# Altium project FMUM.PrjPcb
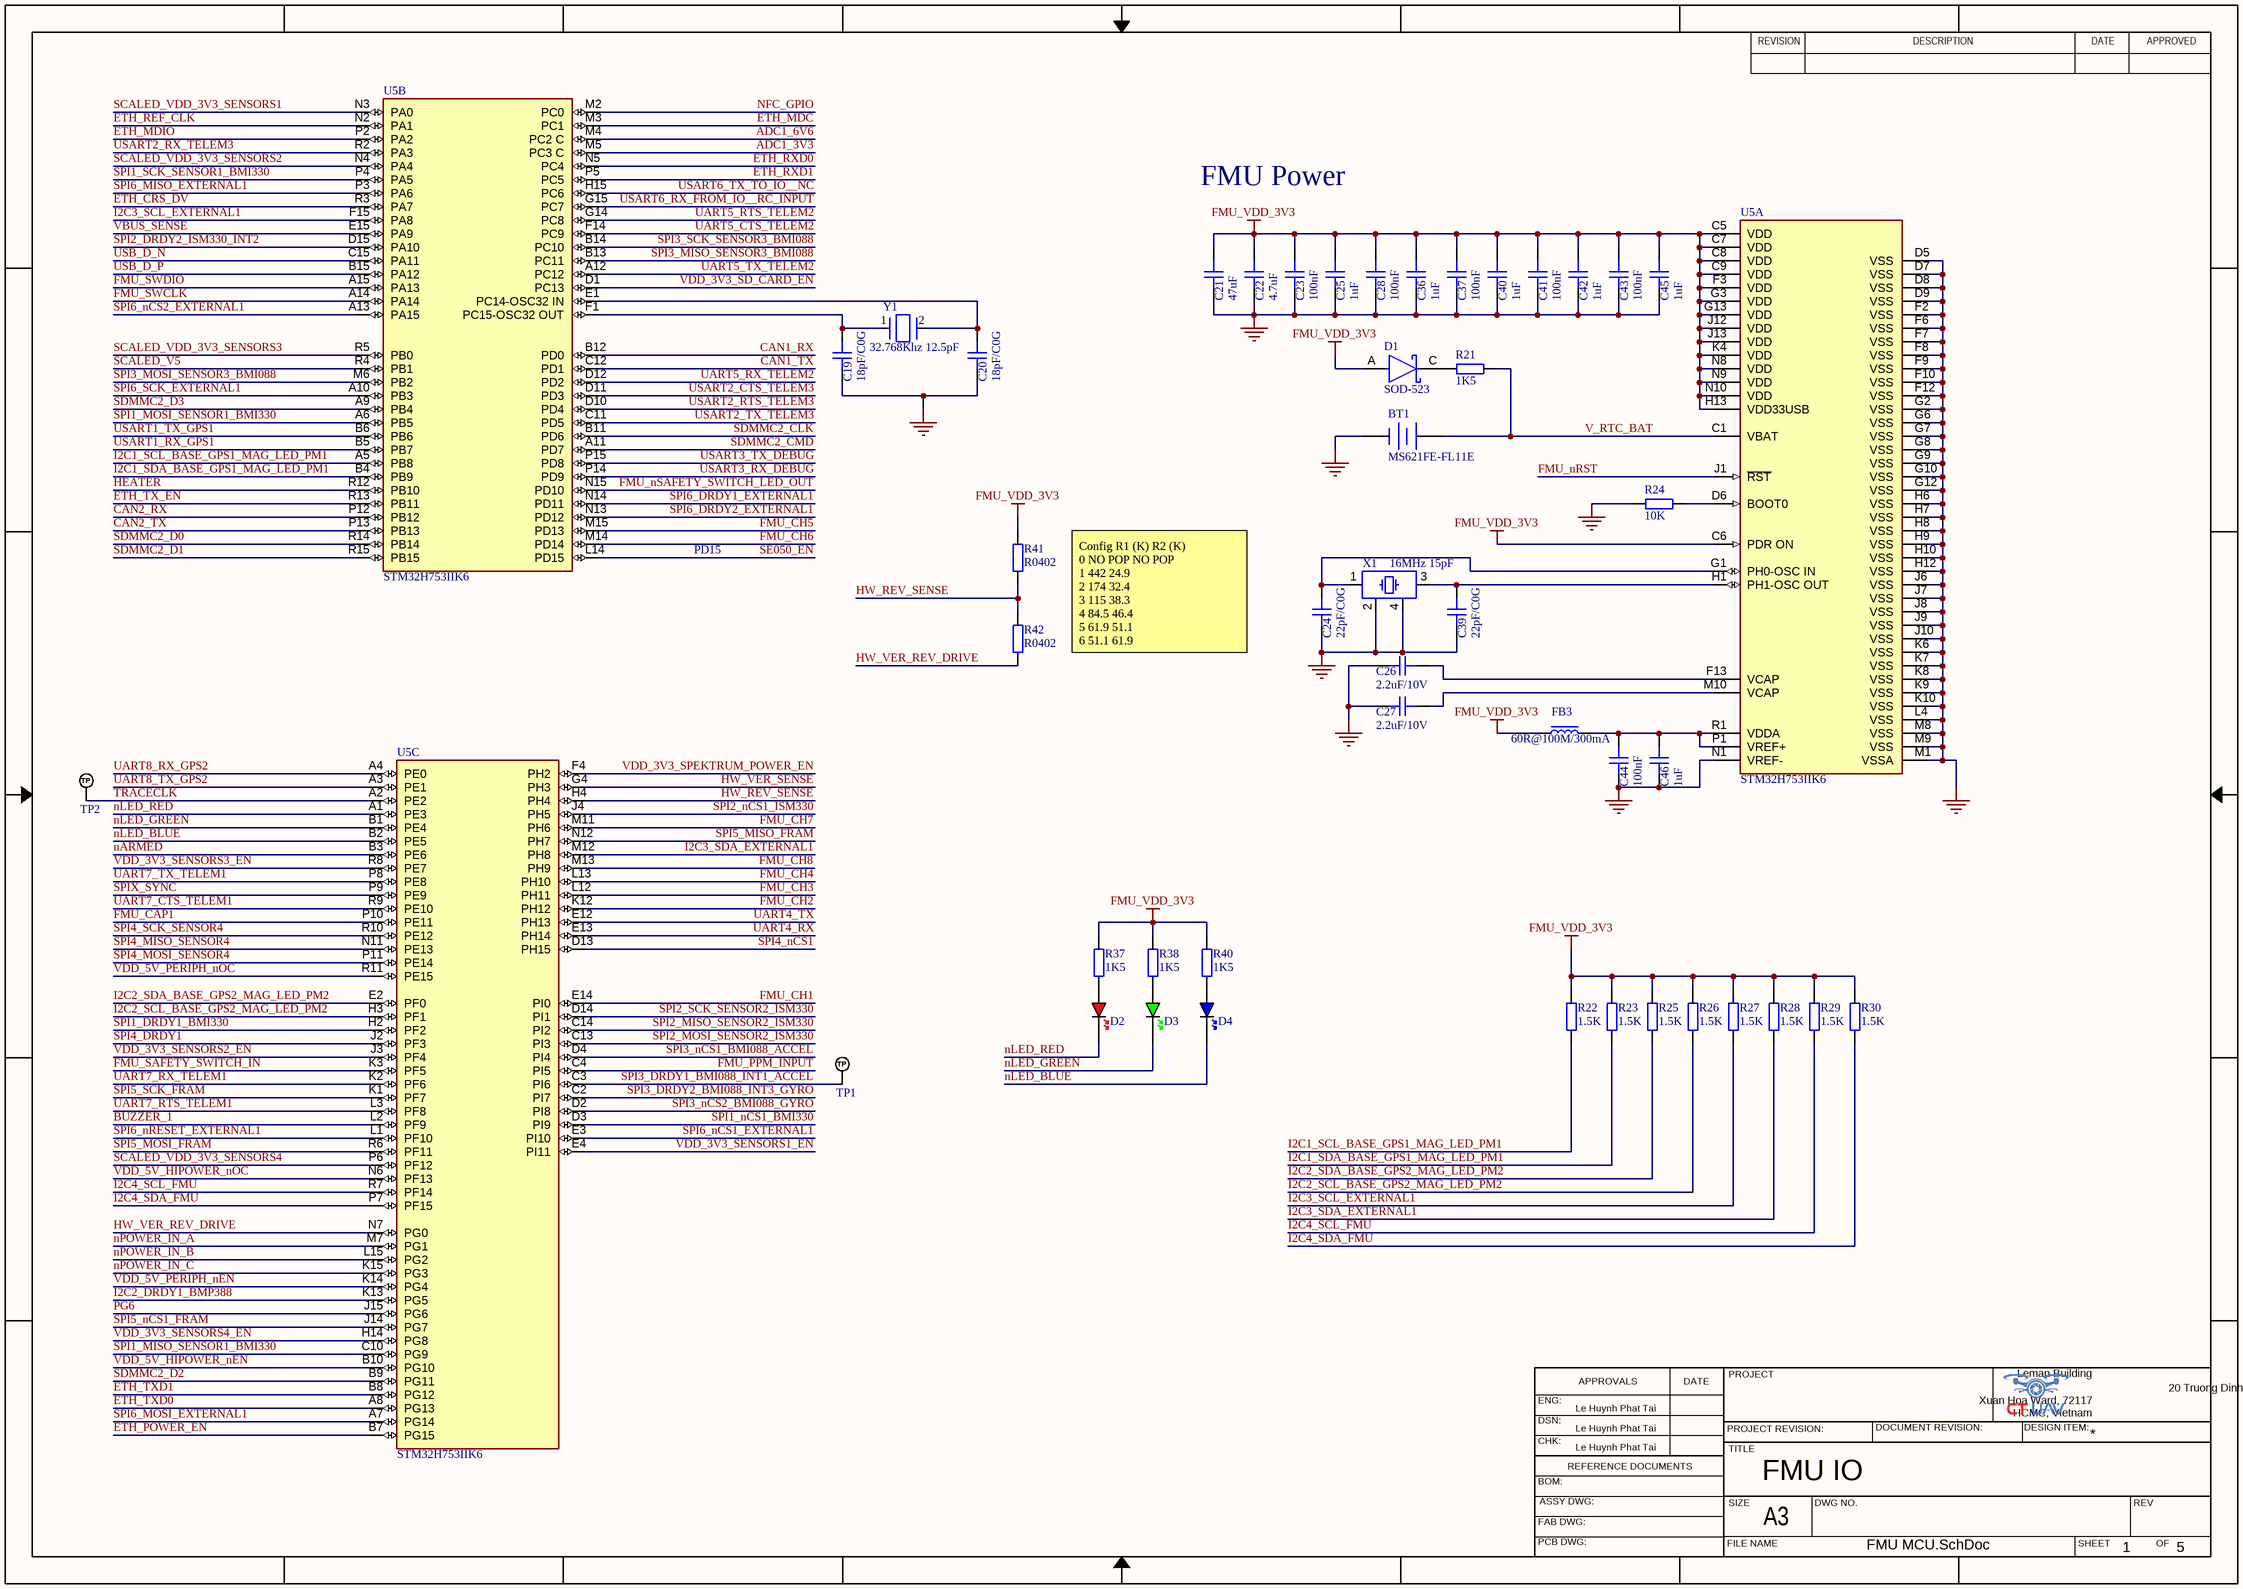
[diagram p0: FMU MCU.SchDoc]
5 sheets, 122 parts. Net scope: global (net labels, ports and power ports of the same name join across sheets).
Board files: FMUM.PcbDoc, 6-layer.PcbDoc
Sheets:
  FMU MCU.SchDoc
  Power.SchDoc
  PAB.SchDoc
  Memory.SchDoc
  Sensors.SchDoc

## Sheet FMU MCU.SchDoc: FMU IO
size 420 x 297 mm; CheckedBy: Le Huynh Phat Tai; DrawnBy: Le Huynh Phat Tai; Engineer: Le Huynh Phat Tai; SheetNumber: 1; SheetTotal: 5

### Parts
BT1  MS621FE-FL11E  [MS621R]
C19  18pF/C0G  [CAPC1005X05N]
C20  18pF/C0G  [CAPC1005X05N]
C21  47uF  [CAPC2012X14N]
C22  4.7uF  [CAPC1608X10N]
C23  100nF  [CAPC1005X05N]
C24  22pF/C0G  [CAPC1005X05N]
C25  1uF  [CAPC1005X05N]
C26  2.2uF/10V  [CAPC1608X10N]
C27  2.2uF/10V  [CAPC1608X10N]
C28  100nF  [CAPC1005X05N]
C36  1uF  [CAPC1005X05N]
C37  100nF  [CAPC1005X05N]
C39  22pF/C0G  [CAPC1005X05N]
C40  1uF  [CAPC1005X05N]
C41  100nF  [CAPC1005X05N]
C42  1uF  [CAPC1005X05N]
C43  100nF  [CAPC1005X05N]
C44  100nF  [CAPC1005X05N]
C45  1uF  [CAPC1005X05N]
C46  1uF  [CAPC1005X05N]
D1  SOD-523  [SODFL160X70-2N]
D2  RED  [LED_0603_RED]  (value not drawn)
D3  GREEN  [LED_0603_GREEN]  (value not drawn)
D4  BLUE  [LED_0603_BLUE]  (value not drawn)
FB3  60R@100M/300mA  [INDC1005X06N]
R21  1K5  [RESC1005X04N]
R22  1.5K  [RESC1005X04N]
R23  1.5K  [RESC1005X04N]
R24  10K  [RESC1005X04N]
R25  1.5K  [RESC1005X04N]
R26  1.5K  [RESC1005X04N]
R27  1.5K  [RESC1005X04N]
R28  1.5K  [RESC1005X04N]
R29  1.5K  [RESC1005X04N]
R30  1.5K  [RESC1005X04N]
R37  1K5  [RESC1005X04N]
R38  1K5  [RESC1005X04N]
R40  1K5  [RESC1005X04N]
R41  R0402  [RESC1005X04N]
R42  R0402  [RESC1005X04N]
TP1  TP_NOBOM  [PAD_RND_1MM]  (value not drawn)  (no BOM)
TP2  TP_NOBOM  [PAD_RND_1MM]  (value not drawn)  (no BOM)
U5  STM32H753IIK6  [BGA176C65P15X15_1000X1000X60N]  (parts A,B,C of 3)
X1  16MHz 15pF  [OSCCC320X250X80]
Y1  32.768Khz 12.5pF  [XTAL3215X80N-2N]

### Nets
FMU_VDD_3V3: C21.2 C22.2 C23.2 C25.2 C28.2 C36.2 C37.2 C40.2 C41.2 C42.2 C43.2 C45.2 D1.A FB3.1 R22.2 R23.2 R25.2 R26.2 R27.2 R28.2 R29.2 R30.2 R37.1 R38.1 R40.1 R41.1 U5.C5(VDD) U5.C6(PDR_ON) U5.C7(VDD) U5.C8(VDD) U5.C9(VDD) U5.F3(VDD) U5.G3(VDD) U5.G13(VDD) U5.H13(VDD33USB) U5.J12(VDD) U5.J13(VDD) U5.K4(VDD) U5.N8(VDD) U5.N9(VDD) U5.N10(VDD)
GND: BT1.2(-) C19.1 C20.1 C21.1 C22.1 C23.1 C24.1 C25.1 C26.2 C27.1 C28.1 C36.1 C37.1 C39.1 C40.1 C41.1 C42.1 C43.1 C44.1 C45.1 C46.1 R24.1 U5.D5(VSS) U5.D7(VSS) U5.D8(VSS) U5.D9(VSS) U5.F2(VSS) U5.F6(VSS) U5.F7(VSS) U5.F8(VSS) U5.F9(VSS) U5.F10(VSS) U5.F12(VSS) U5.G2(VSS) U5.G6(VSS) U5.G7(VSS) U5.G8(VSS) U5.G9(VSS) U5.G10(VSS) U5.G12(VSS) U5.H6(VSS) U5.H7(VSS) U5.H8(VSS) U5.H9(VSS) U5.H10(VSS) U5.H12(VSS) U5.J6(VSS) U5.J7(VSS) U5.J8(VSS) U5.J9(VSS) U5.J10(VSS) U5.K6(VSS) U5.K7(VSS) U5.K8(VSS) U5.K9(VSS) U5.K10(VSS) U5.L4(VSS) U5.M1(VSSA) U5.M8(VSS) U5.M9(VSS) U5.N1(VREF-) X1.2 X1.4
ADC1_3V3: U5.M5(PC3_C)
ADC1_6V6: U5.M4(PC2_C)
BUZZER_1: U5.L2(PF9)
CAN1_RX: U5.B12(PD0)
CAN1_TX: U5.C12(PD1)
CAN2_RX: U5.P12(PB12)
CAN2_TX: U5.P13(PB13)
ETH_CRS_DV: U5.R3(PA7)
ETH_MDC: U5.M3(PC1)
ETH_MDIO: U5.P2(PA2)
ETH_POWER_EN: U5.B7(PG15)
ETH_REF_CLK: U5.N2(PA1)
ETH_RXD0: U5.N5(PC4)
ETH_RXD1: U5.P5(PC5)
ETH_TX_EN: U5.R13(PB11)
ETH_TXD0: U5.A8(PG13)
ETH_TXD1: U5.B8(PG12)
FMU_CAP1: U5.P10(PE11)
FMU_CH1: U5.E14(PI0)
FMU_CH2: U5.K12(PH12)
FMU_CH3: U5.L12(PH11)
FMU_CH4: U5.L13(PH10)
FMU_CH5: U5.M15(PD13)
FMU_CH6: U5.M14(PD14)
FMU_CH7: U5.M11(PH6)
FMU_CH8: U5.M13(PH9)
FMU_nRST: U5.J1(~{RST})
FMU_nSAFETY_SWITCH_LED_OUT: U5.N15(PD10)
FMU_PPM_INPUT: U5.C4(PI5)
FMU_SAFETY_SWITCH_IN: U5.K3(PF5)
FMU_SWCLK: U5.A14(PA14)
FMU_SWDIO: U5.A15(PA13)
HEATER: U5.R12(PB10)
HW_REV_SENSE: R41.2 R42.1 U5.H4(PH4)
HW_VER_REV_DRIVE: R42.2 U5.N7(PG0)
HW_VER_SENSE: U5.G4(PH3)
I2C1_SCL_BASE_GPS1_MAG_LED_PM1: R22.1 U5.A5(PB8)
I2C1_SDA_BASE_GPS1_MAG_LED_PM1: R23.1 U5.B4(PB9)
I2C2_DRDY1_BMP388: U5.K13(PG5)
I2C2_SCL_BASE_GPS2_MAG_LED_PM2: R26.1 U5.H3(PF1)
I2C2_SDA_BASE_GPS2_MAG_LED_PM2: R25.1 U5.E2(PF0)
I2C3_SCL_EXTERNAL1: R27.1 U5.F15(PA8)
I2C3_SDA_EXTERNAL1: R28.1 U5.M12(PH8)
I2C4_SCL_FMU: R29.1 U5.R7(PF14)
I2C4_SDA_FMU: R30.1 U5.P7(PF15)
nARMED: U5.B3(PE6)
NFC_GPIO: U5.M2(PC0)
nLED_BLUE: D4.K U5.B2(PE5)
nLED_GREEN: D3.K U5.B1(PE4)
nLED_RED: D2.K U5.A1(PE3)
nPOWER_IN_A: U5.M7(PG1)
nPOWER_IN_B: U5.L15(PG2)
nPOWER_IN_C: U5.K15(PG3)
PG6: U5.J15(PG6)
SCALED_V5: U5.R4(PB1)
SCALED_VDD_3V3_SENSORS1: U5.N3(PA0)
SCALED_VDD_3V3_SENSORS2: U5.N4(PA4)
SCALED_VDD_3V3_SENSORS3: U5.R5(PB0)
SCALED_VDD_3V3_SENSORS4: U5.P6(PF12)
SDMMC2_CLK: U5.B11(PD6)
SDMMC2_CMD: U5.A11(PD7)
SDMMC2_D0: U5.R14(PB14)
SDMMC2_D1: U5.R15(PB15)
SDMMC2_D2: U5.B9(PG11)
SDMMC2_D3: U5.A9(PB4)
SE050_EN: U5.L14(PD15)
SPI1_DRDY1_BMI330: U5.H2(PF2)
SPI1_MISO_SENSOR1_BMI330: U5.C10(PG9)
SPI1_MOSI_SENSOR1_BMI330: U5.A6(PB5)
SPI1_nCS1_BMI330: U5.D3(PI9)
SPI1_SCK_SENSOR1_BMI330: U5.P4(PA5)
SPI2_DRDY2_ISM330_INT2: U5.D15(PA10)
SPI2_MISO_SENSOR2_ISM330: U5.C14(PI2)
SPI2_MOSI_SENSOR2_ISM330: U5.C13(PI3)
SPI2_nCS1_ISM330: U5.J4(PH5)
SPI2_SCK_SENSOR2_ISM330: U5.D14(PI1)
SPI3_DRDY1_BMI088_INT1_ACCEL: TP1.1(TP) U5.C3(PI6)
SPI3_DRDY2_BMI088_INT3_GYRO: U5.C2(PI7)
SPI3_MISO_SENSOR3_BMI088: U5.B13(PC11)
SPI3_MOSI_SENSOR3_BMI088: U5.M6(PB2)
SPI3_nCS1_BMI088_ACCEL: U5.D4(PI4)
SPI3_nCS2_BMI088_GYRO: U5.D2(PI8)
SPI3_SCK_SENSOR3_BMI088: U5.B14(PC10)
SPI4_DRDY1: U5.J2(PF3)
SPI4_MISO_SENSOR4: U5.N11(PE13)
SPI4_MOSI_SENSOR4: U5.P11(PE14)
SPI4_nCS1: U5.D13(PH15)
SPI4_SCK_SENSOR4: U5.R10(PE12)
SPI5_MISO_FRAM: U5.N12(PH7)
SPI5_MOSI_FRAM: U5.R6(PF11)
SPI5_nCS1_FRAM: U5.J14(PG7)
SPI5_SCK_FRAM: U5.K1(PF7)
SPI6_DRDY1_EXTERNAL1: U5.N14(PD11)
SPI6_DRDY2_EXTERNAL1: U5.N13(PD12)
SPI6_MISO_EXTERNAL1: U5.P3(PA6)
SPI6_MOSI_EXTERNAL1: U5.A7(PG14)
SPI6_nCS1_EXTERNAL1: U5.E3(PI10)
SPI6_nCS2_EXTERNAL1: U5.A13(PA15)
SPI6_nRESET_EXTERNAL1: U5.L1(PF10)
SPI6_SCK_EXTERNAL1: U5.A10(PB3)
SPIX_SYNC: U5.P9(PE9)
TRACECLK: TP2.1(TP) U5.A2(PE2)
UART4_RX: U5.E13(PH14)
UART4_TX: U5.E12(PH13)
UART5_CTS_TELEM2: U5.F14(PC9)
UART5_RTS_TELEM2: U5.G14(PC8)
UART5_RX_TELEM2: U5.D12(PD2)
UART5_TX_TELEM2: U5.A12(PC12)
UART7_CTS_TELEM1: U5.R9(PE10)
UART7_RTS_TELEM1: U5.L3(PF8)
UART7_RX_TELEM1: U5.K2(PF6)
UART7_TX_TELEM1: U5.P8(PE8)
UART8_RX_GPS2: U5.A4(PE0)
UART8_TX_GPS2: U5.A3(PE1)
USART1_RX_GPS1: U5.B5(PB7)
USART1_TX_GPS1: U5.B6(PB6)
USART2_CTS_TELEM3: U5.D11(PD3)
USART2_RTS_TELEM3: U5.D10(PD4)
USART2_RX_TELEM3: U5.R2(PA3)
USART2_TX_TELEM3: U5.C11(PD5)
USART3_RX_DEBUG: U5.P14(PD9)
USART3_TX_DEBUG: U5.P15(PD8)
USART6_RX_FROM_IO__RC_INPUT: U5.G15(PC7)
USART6_TX_TO_IO__NC: U5.H15(PC6)
USB_D_N: U5.C15(PA11)
USB_D_P: U5.B15(PA12)
V_RTC_BAT: BT1.1(+) R21.2 U5.C1(VBAT)
VBUS_SENSE: U5.E15(PA9)
VDD_3V3_SD_CARD_EN: U5.D1(PC13)
VDD_3V3_SENSORS1_EN: U5.E4(PI11)
VDD_3V3_SENSORS2_EN: U5.J3(PF4)
VDD_3V3_SENSORS3_EN: U5.R8(PE7)
VDD_3V3_SENSORS4_EN: U5.H14(PG8)
VDD_3V3_SPEKTRUM_POWER_EN: U5.F4(PH2)
VDD_5V_HIPOWER_nEN: U5.B10(PG10)
VDD_5V_HIPOWER_nOC: U5.N6(PF13)
VDD_5V_PERIPH_nEN: U5.K14(PG4)
VDD_5V_PERIPH_nOC: U5.R11(PE15)
NetC19_2: C19.2 U5.F1(PC15-OSC32_OUT) Y1.1
NetC20_2: C20.2 U5.E1(PC14-OSC32_IN) Y1.2
NetC24_2: C24.2 U5.G1(PH0-OSC_IN) X1.1
NetC26_1: C26.1 U5.F13(VCAP)
NetC27_2: C27.2 U5.M10(VCAP)
NetC39_2: C39.2 U5.H1(PH1-OSC_OUT) X1.3
NetC44_2: C44.2 C46.2 FB3.2 U5.P1(VREF+) U5.R1(VDDA)
NetD1_C: D1.C R21.1
NetD2_A: D2.A R37.2
NetD3_A: D3.A R38.2
NetD4_A: D4.A R40.2
NetR24_2: R24.2 U5.D6(BOOT0)

### Notes on the sheet
- FMU Power
- PD15
- Config	R1 (K)	R2 (K)
  0	NO POP	NO POP
  1	442	24.9
  2	174	32.4
  3	115	38.3
  4	84.5	46.4
  5	61.9	51.1
  6	51.1	61.9
  7	46.4	84.5
  8	38.3	115
  9	32.4	174
  10	24.9	442
- REVISION
- DESCRIPTION
- DATE
- APPROVED
- ENG:
- APPROVALS
- PROJECT
- Xuan Hoa Ward, 72117
- Leman Building
- 20 Truong Dinh
- DSN:
- CHK:
- REFERENCE DOCUMENTS
- PROJECT REVISION:
- TITLE
- DOCUMENT REVISION:
- DESIGN ITEM:
- HCMC, Vietnam
- BOM:
- FAB DWG:
- PCB DWG:
- ASSY DWG:
- FILE NAME
- SIZE
- A3
- DWG NO.
- SHEET
- REV
- OF

### Library data of the parts
BT1 = BATTERY_SINGLE-2: MS Lihium Rechargeable Battery, 3 V, -20 to 60 degC, Tray; Manufacturer: SeikoInstruments; Brand: SeikoInstrumentsMicroEnergy; Output Voltage: 3V; Capacity: 5.5mAh; Chemistry: Lithium; Battery Size: 621; Unit Weight: 0.008113oz; Datasheet URL: http://datasheet.octopart.com/MS621FE-FL11E-Seiko-datasheet-5320152.pdf; Rechargeable/Non-Rechargeable: Rechargeable; Orientation: Vertical; Height: 2.1mm; Series: MS; Datasheet Version: Jan-08; Type: CoinCellBatterywithLeads; Diameter: 6.8mm; Mounting Style: WithLeads; Product Category: CoinCellBattery; Termination Style: ThroughHole; Packaging: Tray; Manufacturer URL: http://www.sii.co.jp/en/; RoHS: NotApplicable; Factory Pack Quantity: 100
C19 C20 C23-C25 C28 C36 C37 C39-C46 = CAP_0402: Capacitor SMD 0402; Manufacturer: *; Manufacturer Part Number: *; Distributor Link: *; LCSC: *; Rating: *; Dielectric: *
C21 = CAP_0805: Capacitor SMD 0805; Manufacturer: *; Manufacturer Part Number: *; Distributor Link: *; LCSC: *; Rating: *; Dielectric: *
C22 C26 C27 = CAP_0603: Capacitor SMD 0603; Manufacturer: *; Manufacturer Part Number: *; Distributor Link: *; LCSC: *; Rating: *; Dielectric: *
D1 = 1d6ec82d83fb6aee721767c19dac4b9: DIODE SCHOTTKY SOD523; Manufacturer: Diodes Inc.; Manufacturer Part Number: SDM20U30-7; Automotive Grade: Grade 1; Forward Current: 200mA; Max Surge Forward Current: 1A; Max Junction Temp: +125°C; Reverse Voltage: 30V; Peak Reverse Current: 150uA; ComponentLink2Description: Datasheet; Automotive: Yes; Octopart: https://octopart.com/sdm20u30-7-diodes+inc.-333874; Device Class L1: Discrete Semiconductors; Footprint Url: https://www.diodes.com/assets/Package-Files/SOD523.pdf; Device Class L3: Schottky Diodes; Height: 0.65mm; Lead Free: Yes; Mouser Description: SDM20U30 Series 20 V 200 mA Surface Mount Schottky Barrier Diode - SOD-523; Temperature Range Low: -65°C; Digikey Description: DIODE SCHOTTKY 30V 200MA SOD523; Category: Diode; RoHS: TRUE; Temperature Range High: +125°C; ComponentLink2URL: https://www.diodes.com/assets/Datasheets/ds30397.pdf; Device Class L2: Diodes; Max Repetitive Reverse Voltage: 30V; Temperature: -65°C to +125°C; Package: SOD523
D2 = LED_0603_RED: LED 0603 RED SMD
D3 = LED_0603_GREEN: LED 0603 GREEN SMD
D4 = LED_0603_BLUE: LED 0603 BLUE SMD
FB3 = FB_0402: Ferrite Bead SMD 0402; Manufacturer: *; Manufacturer Part Number: *; Distributor Link: *; LCSC: *
R21-R30 R37 R38 R40-R42 = RES_0402: Resistor SMD 0402; Manufacturer: *; Manufacturer Part Number: *; Distributor Link: *; LCSC: *
TP1 TP2 = TEST_POINT_RND_1MM: Test Point Round 1mm (NO BOM)
U5 = f2632c7e739cd93bf56a941e5fc9246: UFBGA 10X10X0.6 176+; Manufacturer: STMicroelectronics; Number Of I/Os: 140; Frequency: 400MHz; Data Bus Width: 32bits; Number Of Uart Channels: 9; Number Of Spi Channels: 6; Number Of Timers/Counters: 20; Min Supply Voltage: 1.62V; Memory Size: 2MBytes; Max Junction Temp: +125°C; Number Of I2C Channels: 4; Number Of Pwm Channels: 42; Core Architecture: ARM Cortex-M7; Number Of Adc Channels: 36; Number Of A/D Converters: 3; Max Supply Voltage: 3.6V; Number Of Usb Channels: 2; Interface: I2C,SPI,UART,USART,CAN,USB,LIN,IrDA,Ethernet,I2S,Other; Memory Type: FLASH; Number Of Cores: 1; Ram Size: 1MBytes; Category: IC; Automotive: No; Device Class L1: Integrated Circuits (ICs); ComponentLink2URL: https://www.st.com/resource/en/datasheet/stm32h753ii.pdf; Manufacturer Part Number: STM32H753IIK6; Device Class L2: Embedded Processors and Controllers; Ambient Temperature Range Low: -40°C; ComponentLink2Description: Datasheet; Temperature Range High: +125°C; Temperature Range Low: -40°C; Ipc Land Pattern Name: BGA225N65P15X15_1000X1000X60; Lead Free: Yes; Ambient Temperature Range High: +85°C; Height: 0.6mm; Package: UFBGA176+25-A0E7; Mouser Description: MCU 32-Bit STM32 ARM Cortex M7 RISC 2MB Flash 1.8V/2.5V/3.3V 176-Pin UFBGA Tray; Device Class L3: Microcontrollers; Temperature: -40°C to +125°C; Digikey Description: UFBGA 10X10X0.6 176+; Octopart: https://octopart.com/stm32h753iik6-stmicroelectronics-84735750; Number Of Ethernet Channels: 1; RoHS: TRUE
X1 = TSX-3225_24.0000MF15X-AC: Crystal SMD 24MHz 10PPM 7pF 3225; Manufacturer: Epson; Manufacturer Part Number: TSX-3225 24.0000MF15X-AC
Y1 = c23a69dc6c9e2f18f2079038eb95dd1: NX3215SA-32.768K-STD-MUA-14 Parallel - Fundamental Quartz Crystal, 0.032768MHz Nom; NexarPartId: 22488149; ESR (Equivalent Series Resistance): 70kΩ; Frequency Tolerance: 0.002%; Load Capacitance: 6pF; Width: 1.4986mm; Length: 3.2004mm; RoHS: Compliant; Case/Package: SMD/SMT; Mount: Surface Mount; Height: 889µm; Number of Pins: 2; Packaging: Tape & Reel (TR); Max Operating Temperature: 85°C; Frequency: 32.768kHz; Min Operating Temperature: -40°C

## Sheet Power.SchDoc
size 420 x 297 mm; SheetNumber: 2; SheetTotal: 5
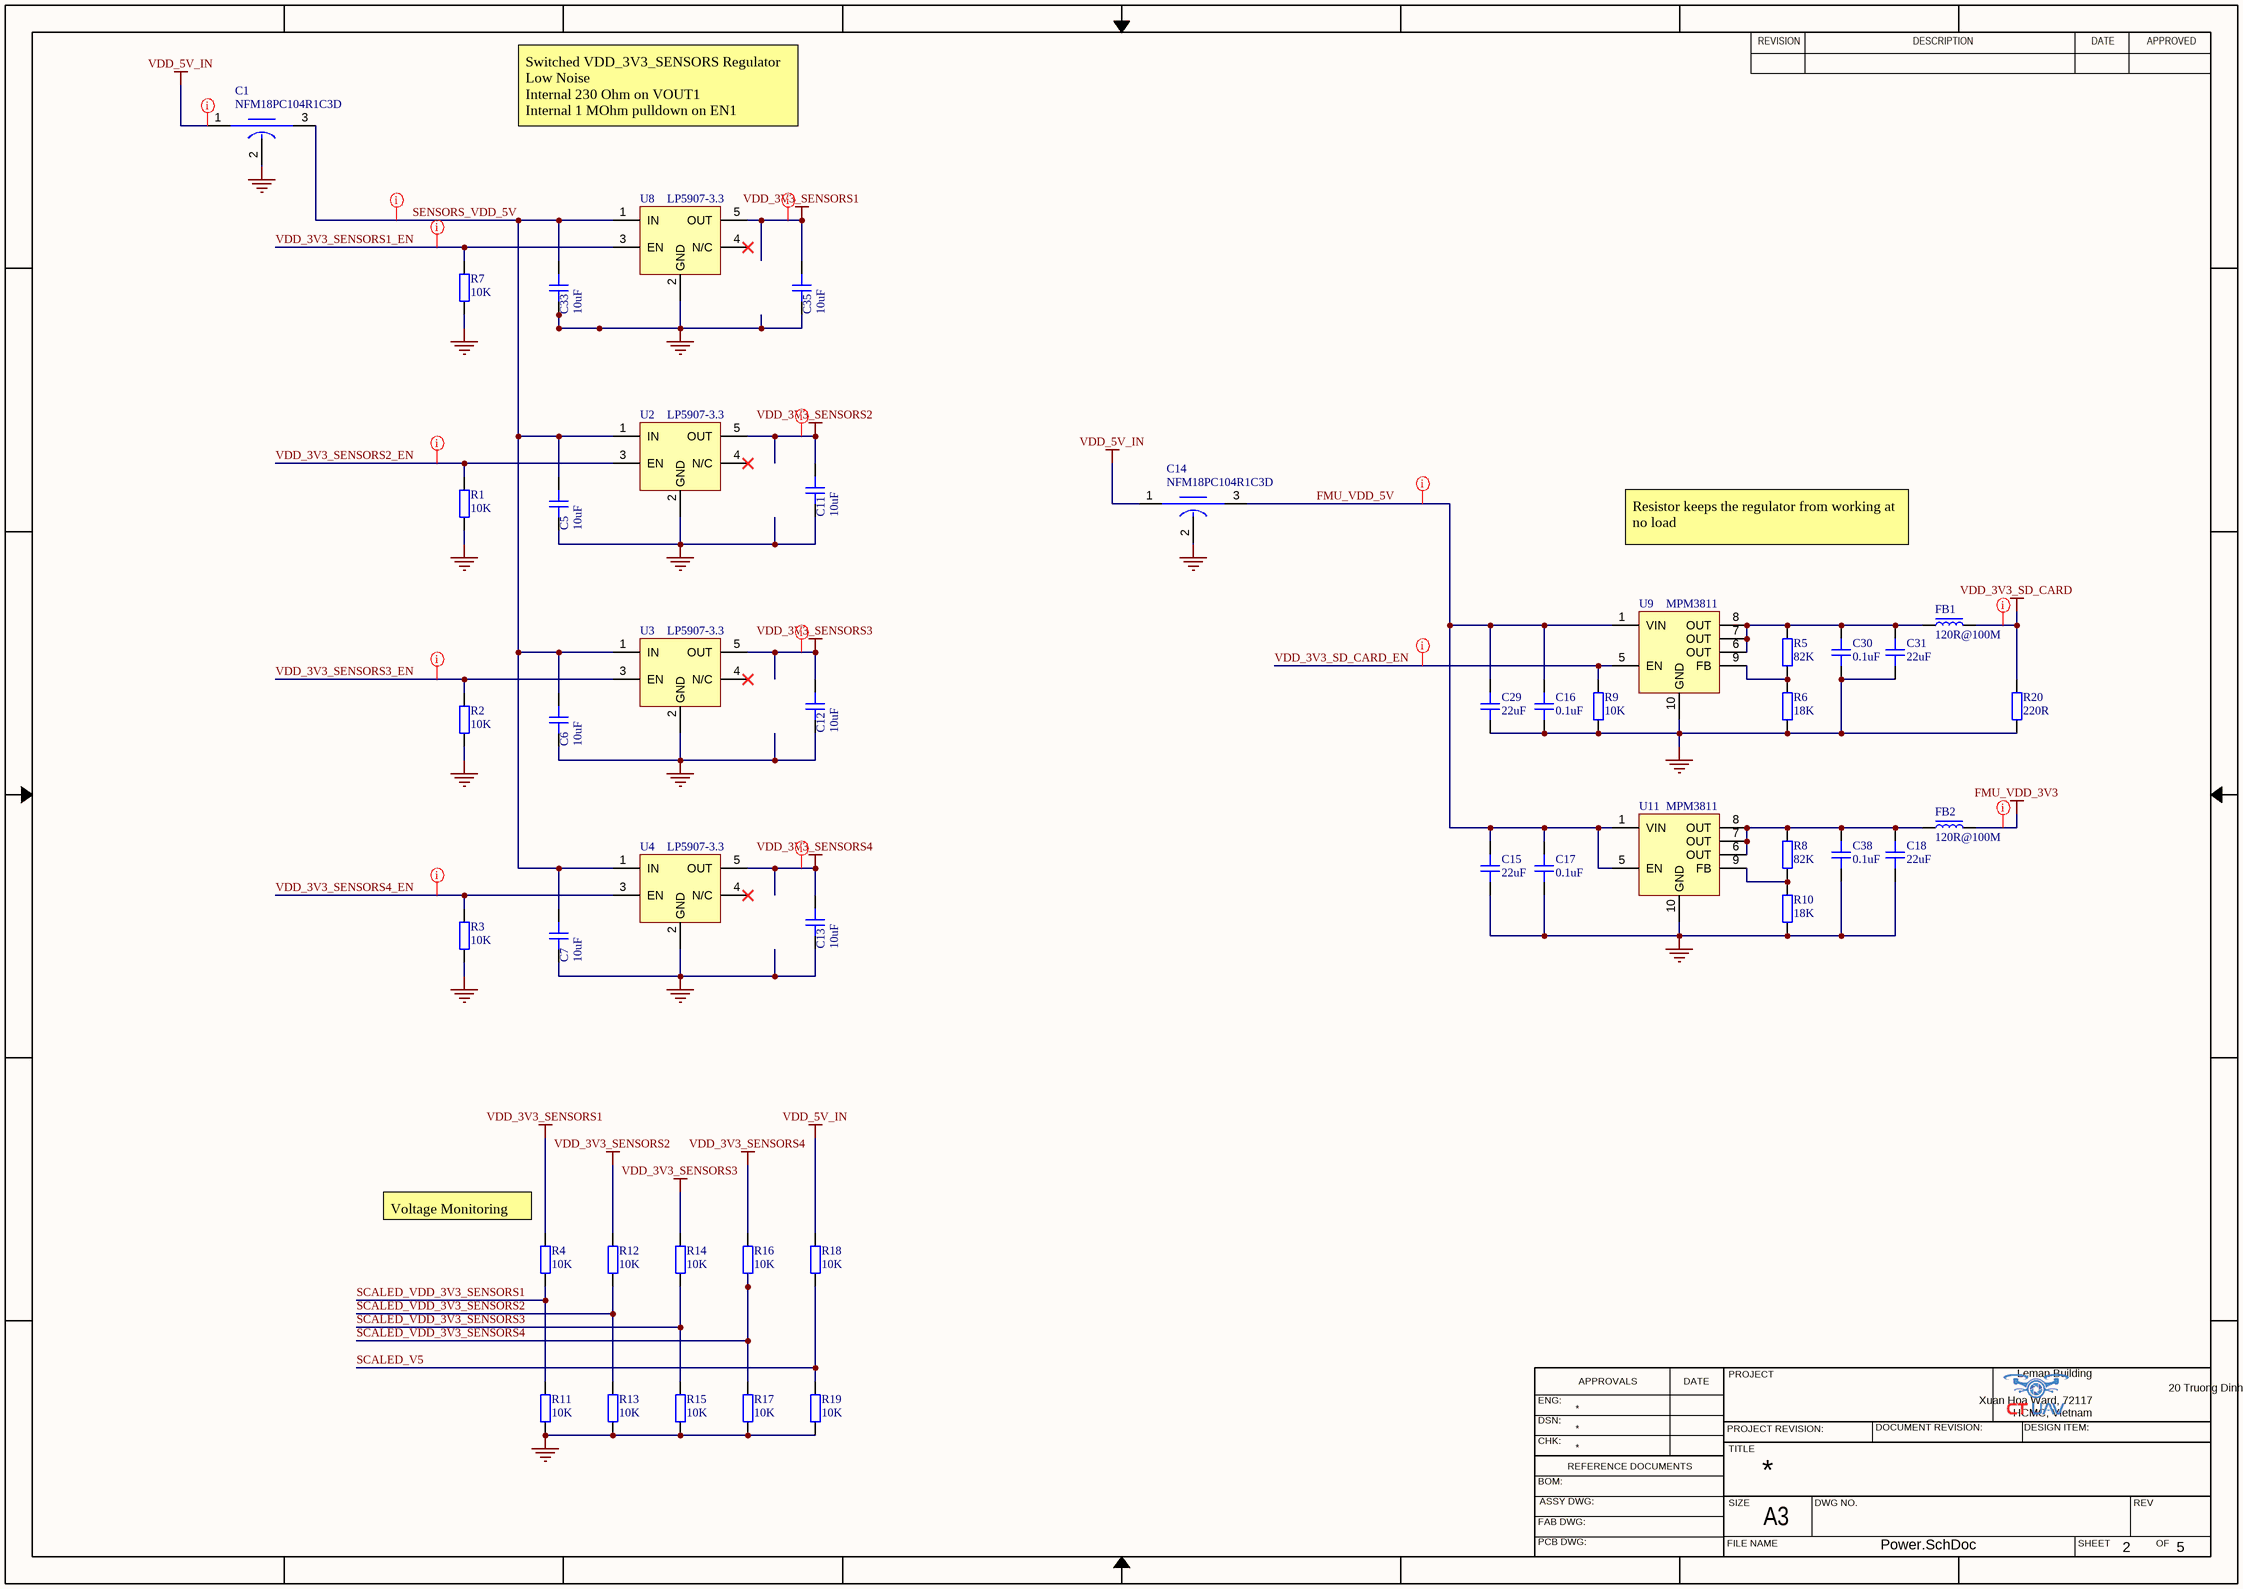
[diagram p1: Power.SchDoc]

### Parts
C1  NFM18PC104R1C3D  [NFM18PC104R1C3_0603_NO_VIA]
C5  10uF  [CAPC1608X10N]
C6  10uF  [CAPC1608X10N]
C7  10uF  [CAPC1608X10N]
C11  10uF  [CAPC1608X10N]
C12  10uF  [CAPC1608X10N]
C13  10uF  [CAPC1608X10N]
C14  NFM18PC104R1C3D  [NFM18PC104R1C3_0603_NO_VIA]
C15  22uF  [CAPC1608X10N]
C16  0.1uF  [CAPC1005X05N]
C17  0.1uF  [CAPC1005X05N]
C18  22uF  [CAPC1608X10N]
C29  22uF  [CAPC1608X10N]
C30  0.1uF  [CAPC1005X05N]
C31  22uF  [CAPC1608X10N]
C33  10uF  [CAPC1608X10N]
C35  10uF  [CAPC1608X10N]
C38  0.1uF  [CAPC1005X05N]
FB1  120R@100M  [INDC1005X06N]
FB2  120R@100M  [INDC1005X06N]
R1  10K  [RESC1005X04N]
R2  10K  [RESC1005X04N]
R3  10K  [RESC1005X04N]
R4  10K  [RESC1005X04N]
R5  82K  [RESC1005X04N]
R6  18K  [RESC1005X04N]
R7  10K  [RESC1005X04N]
R8  82K  [RESC1005X04N]
R9  10K  [RESC1005X04N]
R10  18K  [RESC1005X04N]
R11  10K  [RESC1005X04N]
R12  10K  [RESC1005X04N]
R13  10K  [RESC1005X04N]
R14  10K  [RESC1005X04N]
R15  10K  [RESC1005X04N]
R16  10K  [RESC1005X04N]
R17  10K  [RESC1005X04N]
R18  10K  [RESC1005X04N]
R19  10K  [RESC1005X04N]
R20  220R  [RESC1608X06N]
U2  LP5907-3.3  [SOT-23-5]
U3  LP5907-3.3  [SOT-23-5]
U4  LP5907-3.3  [SOT-23-5]
U8  LP5907-3.3  [SOT-23-5]
U9  MPM3811  [QFN2x2x1p6_MPM3811_MNP]
U11  MPM3811  [QFN2x2x1p6_MPM3811_MNP]

### Nets
FMU_VDD_3V3: FB2.2
GND: C1.2(GND) C5.1 C6.1 C7.1 C11.1 C12.1 C13.1 C14.2(GND) C15.1 C16.1 C17.1 C18.1 C29.1 C30.1 C31.1 C33.1 C35.1 C38.1 R1.2 R2.2 R3.2 R6.1 R7.2 R9.2 R10.1 R11.1 R13.1 R15.1 R17.1 R19.1 R20.1 U2.2(GND) U3.2(GND) U4.2(GND) U8.2(GND) U9.10(GND) U11.10(GND)
VDD_3V3_SD_CARD: FB1.2 R20.2
VDD_3V3_SENSORS1: C35.2 R4.2 U8.5(OUT)
VDD_3V3_SENSORS2: C11.2 R12.2 U2.5(OUT)
VDD_3V3_SENSORS3: C12.2 R14.2 U3.5(OUT)
VDD_3V3_SENSORS4: C13.2 R16.2 U4.5(OUT)
VDD_5V_IN: C1.1(Input) C14.1(Input) R18.2
FMU_VDD_5V: C14.3(Output) C15.2 C16.2 C17.2 C29.2 U9.1(VIN) U11.1(VIN) U11.5(EN)
SCALED_V5: R18.1 R19.2
SCALED_VDD_3V3_SENSORS1: R4.1 R11.2
SCALED_VDD_3V3_SENSORS2: R12.1 R13.2
SCALED_VDD_3V3_SENSORS3: R14.1 R15.2
SCALED_VDD_3V3_SENSORS4: R16.1 R17.2
SENSORS_VDD_5V: C1.3(Output) C5.2 C6.2 C7.2 C33.2 U2.1(IN) U3.1(IN) U4.1(IN) U8.1(IN)
VDD_3V3_SD_CARD_EN: R9.1 U9.5(EN)
VDD_3V3_SENSORS1_EN: R7.1 U8.3(EN)
VDD_3V3_SENSORS2_EN: R1.1 U2.3(EN)
VDD_3V3_SENSORS3_EN: R2.1 U3.3(EN)
VDD_3V3_SENSORS4_EN: R3.1 U4.3(EN)
NetC18_2: C18.2 C38.2 FB2.1 R8.2 U11.6(OUT) U11.7(OUT) U11.8(OUT)
NetC30_2: C30.2 C31.2 FB1.1 R5.2 U9.6(OUT) U9.7(OUT) U9.8(OUT)
NetR5_1: R5.1 R6.2 U9.9(FB)
NetR8_1: R8.1 R10.2 U11.9(FB)

Not connected (* = marked no-connect by the designer): U2 4(N/C)*; U3 4(N/C)*; U4 4(N/C)*; U8 4(N/C)*

### Layout directives
net class Power: FMU_VDD_3V3, FMU_VDD_5V, SENSORS_VDD_5V, VDD_3V3_SD_CARD, VDD_3V3_SD_CARD_EN, VDD_3V3_SENSORS1, VDD_3V3_SENSORS1_EN, VDD_3V3_SENSORS2, VDD_3V3_SENSORS2_EN, VDD_3V3_SENSORS3, VDD_3V3_SENSORS3_EN, VDD_3V3_SENSORS4, VDD_3V3_SENSORS4_EN, VDD_5V_IN

### Notes on the sheet
- Switched VDD_3V3_SENSORS Regulator
  Low Noise
  Internal 230 Ohm on VOUT1
  Internal 1 MOhm pulldown on EN1
- Resistor keeps the regulator from working at no load
- (near R4) Voltage Monitoring
- REVISION
- DESCRIPTION
- DATE
- APPROVED
- ENG:
- APPROVALS
- PROJECT
- Xuan Hoa Ward, 72117
- Leman Building
- 20 Truong Dinh
- DSN:
- CHK:
- REFERENCE DOCUMENTS
- PROJECT REVISION:
- TITLE
- DOCUMENT REVISION:
- DESIGN ITEM:
- HCMC, Vietnam
- BOM:
- FAB DWG:
- PCB DWG:
- ASSY DWG:
- FILE NAME
- SIZE
- A3
- DWG NO.
- SHEET
- REV
- OF

### Library data of the parts
C1 C14 = 968ca41a07abfef6fd4f7114a56c54f: Large Current 3 Terminals Low ESL Chip Multilayer Ceramic Capacitors for General Purpose, 0603, 0.10uF, 20%, 16V; Capacitance: 100nF; Insulation Resistance: 1GR; Current Rating: 2A; DC Resistance (DCR): 30mR; Case Code (Imperial): 0603; REACH SVHC: No SVHC; Width: 0.8mm; Case Code (Metric): 1608; Voltage Rating (DC): 16V; Case/Package: 0603; Packaging: Tape and Reel; Length: 1.6mm; Height: 0.6mm; Voltage: 16V; Depth: 0.8mm; Radiation Hardening: No; Max Operating Temperature: 125°C; Max Voltage Rating (DC): 16V; Voltage Rating: 16V; Max Current Rating: 2A; Tolerance: 20%; Min Operating Temperature: -55°C; Mount: PCB; Termination: Flat; Current: 2A; Package Quantity: 4000; Lead Free: Lead Free
C5-C7 C11-C13 C15 C18 C29 C31 C33 C35 = CAP_0603: Capacitor SMD 0603; Manufacturer: *; Manufacturer Part Number: *; Distributor Link: *; LCSC: *; Rating: *; Dielectric: *
C16 C17 C30 C38 = CAP_0402: Capacitor SMD 0402; Manufacturer: *; Manufacturer Part Number: *; Distributor Link: *; LCSC: *; Rating: *; Dielectric: *
FB1 FB2 = FB_0402: Ferrite Bead SMD 0402; Manufacturer: *; Manufacturer Part Number: *; Distributor Link: *; LCSC: *
R1-R19 = RES_0402: Resistor SMD 0402; Manufacturer: *; Manufacturer Part Number: *; Distributor Link: *; LCSC: *
R20 = RES_0603: Resistor SMD 0603; Manufacturer: *; Manufacturer Part Number: *; Distributor Link: *; LCSC: *
U2-U4 U8 = LP5907-3.3: 82dB@(1kHz) 250mA Fixed 3.3V Positive 5.5V SOT-23-5 Voltage Regulators - Linear, Low Drop Out (LDO) Regulators ROHS
U9 U11 = MPM3811: Non-Isolated PoL Module DC DC Converter 1 Output 0.6 ~ 3.3V 1A 2.3V - 5.5V Input

## Sheet PAB.SchDoc
size 420 x 297 mm; SheetNumber: 3; SheetTotal: 5
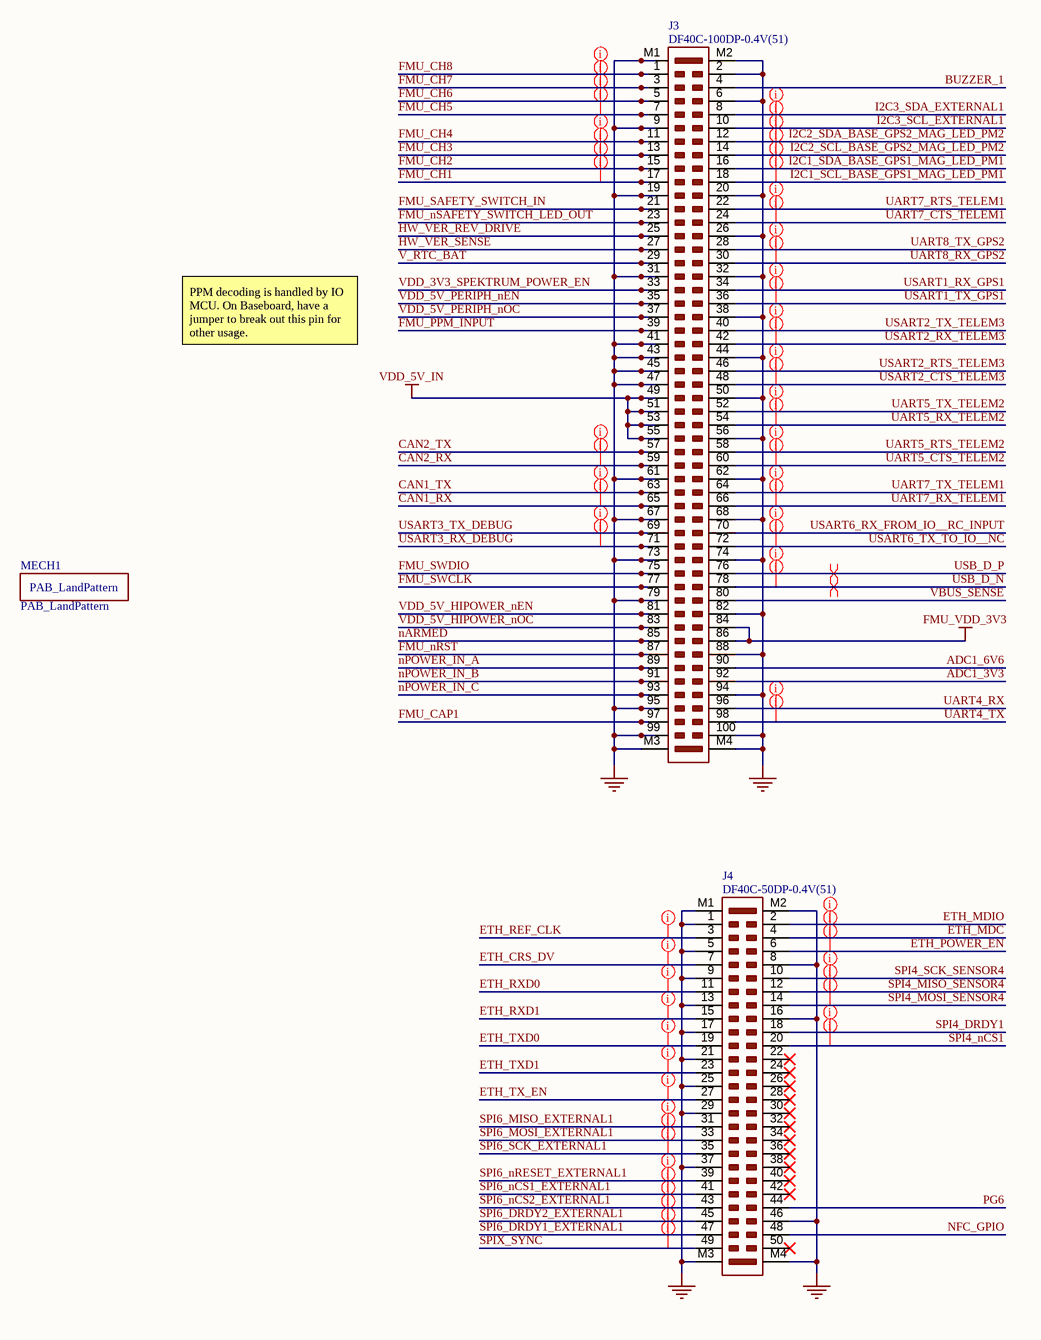
[diagram p2: PAB.SchDoc]

### Parts
J3  Manufacturer Part Number: DF40C-100DP-0.4V(51)  [HIROSE_DF40C-100DP-0_4V51]  (hidden comment: CONN HDR 100POS 0.4MM SMD GOLD)
J4  Manufacturer Part Number: DF40C-50DP-0.4V(51)  [HIROSE_DF40C-50DP-0-4V51]  (hidden comment: CONN HDR 50POS 0.4MM SMD GOLD)
MECH1  PAB_LandPattern  [PAB_LandPattern]  (mechanical)

### Nets
FMU_VDD_3V3: J3.84 J3.86
GND: J3.2 J3.6 J3.9 J3.19 J3.20 J3.26 J3.31 J3.32 J3.38 J3.41 J3.43 J3.44 J3.45 J3.47 J3.50 J3.56 J3.61 J3.62 J3.67 J3.68 J3.73 J3.74 J3.79 J3.82 J3.88 J3.94 J3.95 J3.99 J3.100 J3.M1 J3.M2 J3.M3 J3.M4 J4.1 J4.5 J4.8 J4.9 J4.13 J4.16 J4.17 J4.21 J4.25 J4.29 J4.37 J4.46 J4.M1 J4.M2 J4.M3 J4.M4
VDD_5V_IN: J3.49 J3.51 J3.53 J3.55
ADC1_3V3: J3.92
ADC1_6V6: J3.90
BUZZER_1: J3.4
CAN1_RX: J3.65
CAN1_TX: J3.63
CAN2_RX: J3.59
CAN2_TX: J3.57
ETH_CRS_DV: J4.7
ETH_MDC: J4.4
ETH_MDIO: J4.2
ETH_POWER_EN: J4.6
ETH_REF_CLK: J4.3
ETH_RXD0: J4.11
ETH_RXD1: J4.15
ETH_TX_EN: J4.27
ETH_TXD0: J4.19
ETH_TXD1: J4.23
FMU_CAP1: J3.97
FMU_CH1: J3.17
FMU_CH2: J3.15
FMU_CH3: J3.13
FMU_CH4: J3.11
FMU_CH5: J3.7
FMU_CH6: J3.5
FMU_CH7: J3.3
FMU_CH8: J3.1
FMU_nRST: J3.87
FMU_nSAFETY_SWITCH_LED_OUT: J3.23
FMU_PPM_INPUT: J3.39
FMU_SAFETY_SWITCH_IN: J3.21
FMU_SWCLK: J3.77
FMU_SWDIO: J3.75
HW_VER_REV_DRIVE: J3.25
HW_VER_SENSE: J3.27
I2C1_SCL_BASE_GPS1_MAG_LED_PM1: J3.18
I2C1_SDA_BASE_GPS1_MAG_LED_PM1: J3.16
I2C2_SCL_BASE_GPS2_MAG_LED_PM2: J3.14
I2C2_SDA_BASE_GPS2_MAG_LED_PM2: J3.12
I2C3_SCL_EXTERNAL1: J3.10
I2C3_SDA_EXTERNAL1: J3.8
nARMED: J3.85
NFC_GPIO: J4.48
nPOWER_IN_A: J3.89
nPOWER_IN_B: J3.91
nPOWER_IN_C: J3.93
PG6: J4.44
SPI4_DRDY1: J4.18
SPI4_MISO_SENSOR4: J4.12
SPI4_MOSI_SENSOR4: J4.14
SPI4_nCS1: J4.20
SPI4_SCK_SENSOR4: J4.10
SPI6_DRDY1_EXTERNAL1: J4.47
SPI6_DRDY2_EXTERNAL1: J4.45
SPI6_MISO_EXTERNAL1: J4.31
SPI6_MOSI_EXTERNAL1: J4.33
SPI6_nCS1_EXTERNAL1: J4.41
SPI6_nCS2_EXTERNAL1: J4.43
SPI6_nRESET_EXTERNAL1: J4.39
SPI6_SCK_EXTERNAL1: J4.35
SPIX_SYNC: J4.49
UART4_RX: J3.96
UART4_TX: J3.98
UART5_CTS_TELEM2: J3.60
UART5_RTS_TELEM2: J3.58
UART5_RX_TELEM2: J3.54
UART5_TX_TELEM2: J3.52
UART7_CTS_TELEM1: J3.24
UART7_RTS_TELEM1: J3.22
UART7_RX_TELEM1: J3.66
UART7_TX_TELEM1: J3.64
UART8_RX_GPS2: J3.30
UART8_TX_GPS2: J3.28
USART1_RX_GPS1: J3.34
USART1_TX_GPS1: J3.36
USART2_CTS_TELEM3: J3.48
USART2_RTS_TELEM3: J3.46
USART2_RX_TELEM3: J3.42
USART2_TX_TELEM3: J3.40
USART3_RX_DEBUG: J3.71
USART3_TX_DEBUG: J3.69
USART6_RX_FROM_IO__RC_INPUT: J3.70
USART6_TX_TO_IO__NC: J3.72
USB_D_N: J3.78
USB_D_P: J3.76
V_RTC_BAT: J3.29
VBUS_SENSE: J3.80
VDD_3V3_SPEKTRUM_POWER_EN: J3.33
VDD_5V_HIPOWER_nEN: J3.81
VDD_5V_HIPOWER_nOC: J3.83
VDD_5V_PERIPH_nEN: J3.35
VDD_5V_PERIPH_nOC: J3.37

Not connected (* = marked no-connect by the designer): J4 22* 24* 26* 28* 30* 32* 34* 36* 38* 40* 42* 50*

### Layout directives
net class PWM; net class PWM: FMU_CH8
net class PWM: FMU_CH1, FMU_CH2, FMU_CH3, FMU_CH4, FMU_CH5, FMU_CH6, FMU_CH7
net class CAN2: CAN2_RX, CAN2_TX
net class CAN1: CAN1_RX, CAN1_TX
net class USART3: USART3_RX_DEBUG, USART3_TX_DEBUG
net class I2C3: I2C3_SCL_EXTERNAL1, I2C3_SDA_EXTERNAL1
net class I2C2: I2C2_SCL_BASE_GPS2_MAG_LED_PM2, I2C2_SDA_BASE_GPS2_MAG_LED_PM2
net class I2C1: I2C1_SCL_BASE_GPS1_MAG_LED_PM1, I2C1_SDA_BASE_GPS1_MAG_LED_PM1
net class UART7: UART7_CTS_TELEM1, UART7_RTS_TELEM1, UART7_RX_TELEM1, UART7_TX_TELEM1
net class UART8: UART8_RX_GPS2, UART8_TX_GPS2
net class USART1: USART1_RX_GPS1, USART1_TX_GPS1
net class USART2: USART2_CTS_TELEM3, USART2_RTS_TELEM3, USART2_RX_TELEM3, USART2_TX_TELEM3
net class UART5: UART5_CTS_TELEM2, UART5_RTS_TELEM2, UART5_RX_TELEM2, UART5_TX_TELEM2
net class USART6: USART6_RX_FROM_IO__RC_INPUT, USART6_TX_TO_IO__NC
net class USB: USB_D_N, USB_D_P
differential pair: USB_D_N, USB_D_P
net class ETH_RMII_TX: ETH_REF_CLK, ETH_TX_EN, ETH_TXD0, ETH_TXD1
net class ETH_RMII_RX: ETH_CRS_DV, ETH_RXD0, ETH_RXD1
net class ETH_RMII_SLOW: ETH_MDC, ETH_MDIO, ETH_POWER_EN
net class SPI4: SPI4_DRDY1, SPI4_MISO_SENSOR4, SPI4_MOSI_SENSOR4, SPI4_nCS1, SPI4_SCK_SENSOR4
net class SPI6: SPI6_DRDY1_EXTERNAL1, SPI6_DRDY2_EXTERNAL1, SPI6_MISO_EXTERNAL1, SPI6_MOSI_EXTERNAL1, SPI6_nCS1_EXTERNAL1, SPI6_nCS2_EXTERNAL1, SPI6_nRESET_EXTERNAL1, SPI6_SCK_EXTERNAL1, SPIX_SYNC
net class UART4: UART4_RX, UART4_TX

### Notes on the sheet
- PPM decoding is handled by IO MCU. On Baseboard, have a jumper to break out this pin for other usage.
- REVISION
- DESCRIPTION
- DATE
- APPROVED
- ENG:
- APPROVALS
- PROJECT
- Xuan Hoa Ward, 72117
- Leman Building
- 20 Truong Dinh
- DSN:
- CHK:
- REFERENCE DOCUMENTS
- PROJECT REVISION:
- TITLE
- DOCUMENT REVISION:
- DESIGN ITEM:
- HCMC, Vietnam
- BOM:
- FAB DWG:
- PCB DWG:
- ASSY DWG:
- FILE NAME
- SIZE
- A3
- DWG NO.
- SHEET
- REV
- OF

### Library data of the parts
J3 = CONN_HDR_2X50_PLUG_0.4MM_SMD: Manufacturer: Hirose Electric Co Ltd; Number of Positions: 100; Pitch: 0.016" (0.40mm); System: Connector; Packaging: Cut Tape (CT); Part Status: Active; Number of Rows: 2; Mounting Type: Surface Mount; Operating Temperature: -65°C ~ 85°C; Supplier 1: Digi-Key; Supplier Part Number 1: H11614CT-ND; Category: Connectors, Interconnects; Stock 1: 27593; Pricing 1: 1=1.96 (USD); ComponentLink1Description: https://www.digikey.com/product-detail/en/hirose-electric-co-ltd/DF40C-100DP-0.4V-51/H11614CT-ND/1969494; ComponentLink1URL: https://www.digikey.com/product-detail/en/hirose-electric-co-ltd/DF40C-100DP-0.4V-51/H11614CT-ND/1969494
J4 = CONN_HDR_2X25_PLUG_0.4MM_SMD: Manufacturer: Hirose Electric Co Ltd; Number of Positions: 50; Pitch: 0.016" (0.40mm); System: Connector; Packaging: Cut Tape (CT); Part Status: Active; Number of Rows: 2; Mounting Type: Surface Mount; Operating Temperature: -65°C ~ 85°C; Supplier 1: Digi-Key; Supplier Part Number 1: H11626CT-ND; Category: Connectors, Interconnects; Stock 1: 57993; Pricing 1: 1=1.12, 10=0.982, 25=0.924, 50=0.8856, 100=0.847, 250=0.77, 500=0.693, 1000=0.616 (USD); ComponentLink1Description: https://www.digikey.com/products/en/connectors-interconnects/rectangular-connectors-arrays-edge-type-mezzanine-board-to-board/308?k=DF40C-50DP-0.4V51&k=&pkeyword=DF40C-50DP-0.4V51&pv7=2&sf=0&quantity=&ColumnSort=0&page=1&pageSize=25; ComponentLink1URL: https://www.digikey.com/products/en/connectors-interconnects/rectangular-connectors-arrays-edge-type-mezzanine-board-to-board/308?k=DF40C-50DP-0.4V51&k=&pkeyword=DF40C-50DP-0.4V51&pv7=2&sf=0&quantity=&ColumnSort=0&page=1&pageSize=25

## Sheet Memory.SchDoc
size 420 x 297 mm; SheetNumber: 4; SheetTotal: 5
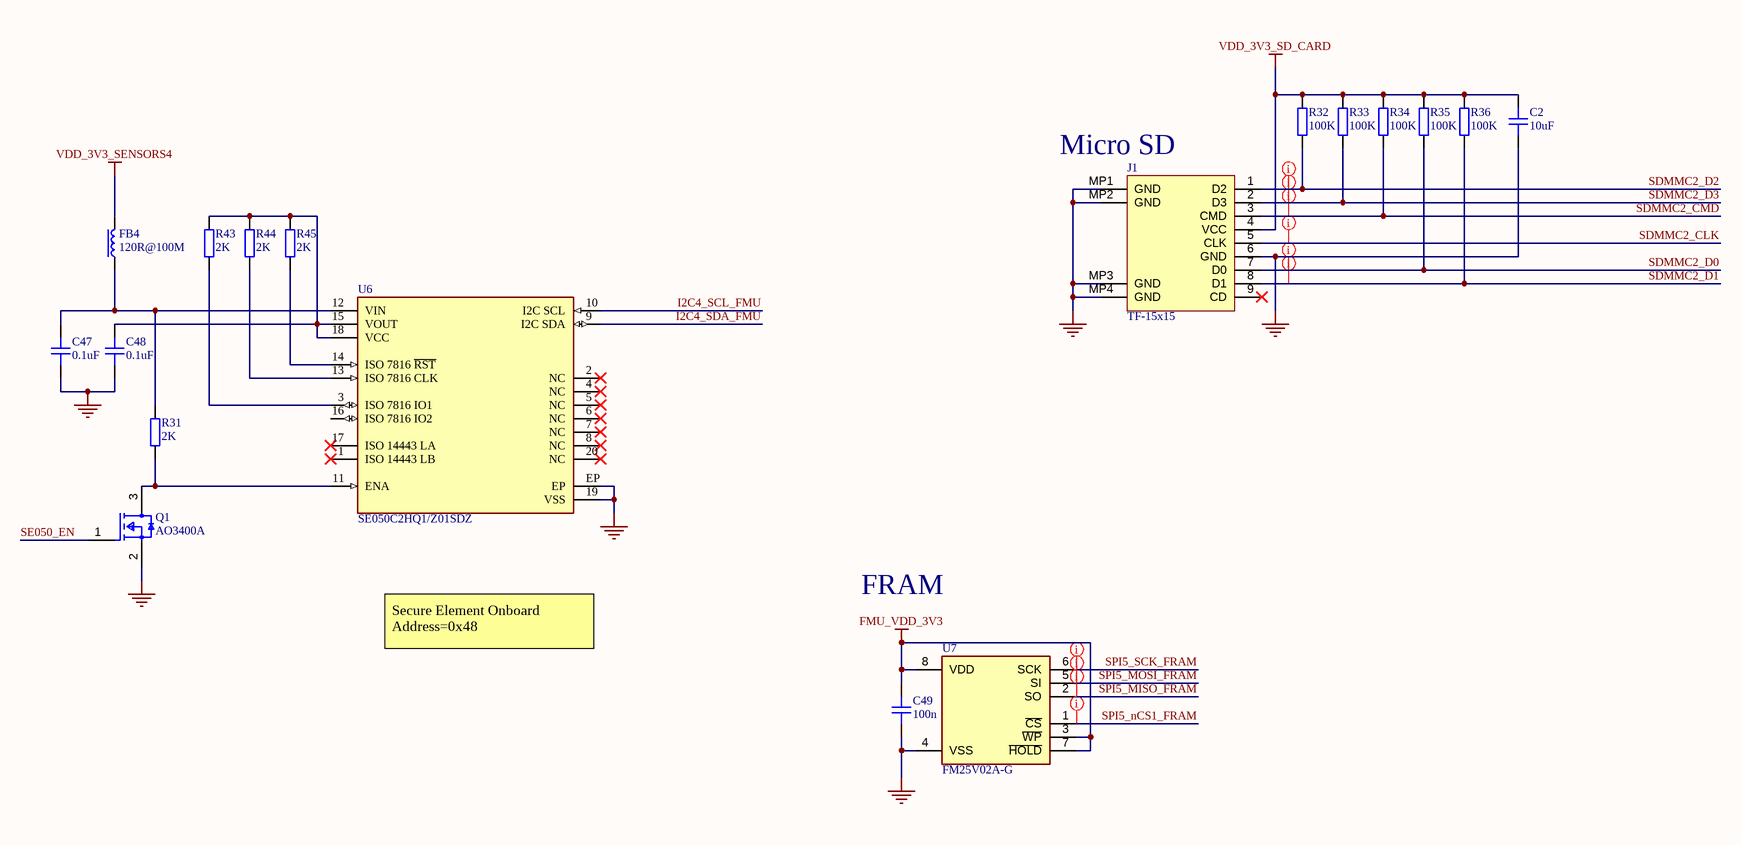
[diagram p3: Memory.SchDoc]

### Parts
C2  10uF  [CAPC1608X10N]
C47  0.1uF  [CAPC1005X05N]
C48  0.1uF  [CAPC1005X05N]
C49  100n  [CAPC1005X05N]
FB4  120R@100M  [INDC1005X06N]
J1  TF-15x15  [TF15X15]
Q1  AO3400A  [SOT95P280X125-3N]
R31  2K  [RESC1005X04N]
R32  100K  [RESC1005X04N]
R33  100K  [RESC1005X04N]
R34  100K  [RESC1005X04N]
R35  100K  [RESC1005X04N]
R36  100K  [RESC1005X04N]
R43  2K  [RESC1005X04N]
R44  2K  [RESC1005X04N]
R45  2K  [RESC1005X04N]
U6  SE050C2HQ1/Z01SDZ  [SOT1969-1 NXP]
U7  FM25V02A-G  [SOT127P602X155-8N]

### Nets
FMU_VDD_3V3: C49.2 U7.3(~{WP}) U7.7(~{HOLD}) U7.8(VDD)
GND: C2.1 C47.1 C48.1 C49.1 J1.6(GND) J1.MP1(GND) J1.MP2(GND) J1.MP3(GND) J1.MP4(GND) Q1.2(S) U6.19(VSS) U6.EP U7.4(VSS)
VDD_3V3_SD_CARD: C2.2 J1.4(VCC) R32.2 R33.2 R34.2 R35.2 R36.2
VDD_3V3_SENSORS4: FB4.2
I2C4_SCL_FMU: U6.10(I2C_SCL)
I2C4_SDA_FMU: U6.9(I2C_SDA)
SDMMC2_CLK: J1.5(CLK)
SDMMC2_CMD: J1.3(CMD) R34.1
SDMMC2_D0: J1.7(D0) R35.1
SDMMC2_D1: J1.8(D1) R36.1
SDMMC2_D2: J1.1(D2) R32.1
SDMMC2_D3: J1.2(D3) R33.1
SE050_EN: Q1.1(G)
SPI5_MISO_FRAM: U7.2(SO)
SPI5_MOSI_FRAM: U7.5(SI)
SPI5_nCS1_FRAM: U7.1(~{CS})
SPI5_SCK_FRAM: U7.6(SCK)
NetC47_2: C47.2 FB4.1 R31.2 U6.12(VIN)
NetC48_2: C48.2 R43.2 R44.2 R45.2 U6.15(VOUT) U6.18(VCC)
NetQ1_3: Q1.3(D) R31.1 U6.11(ENA)
NetR43_1: R43.1 U6.3(ISO_7816_IO1)
NetR44_1: R44.1 U6.13(ISO_7816_CLK)
NetR45_1: R45.1 U6.14(ISO_7816_~{RST})

Not connected (* = marked no-connect by the designer): J1 9(CD)*; U6 1(ISO_14443_LB)* 2(NC)* 4(NC)* 5(NC)* 6(NC)* 7(NC)* 8(NC)* 16(ISO_7816_IO2) 17(ISO_14443_LA)* 20(NC)*

### Layout directives
net class SDMMC: SDMMC2_CLK, SDMMC2_CMD, SDMMC2_D0, SDMMC2_D1, SDMMC2_D2, SDMMC2_D3
net class SPI5: SPI5_MISO_FRAM, SPI5_MOSI_FRAM, SPI5_nCS1_FRAM, SPI5_SCK_FRAM

### Notes on the sheet
- (near J1) Micro SD
- Secure Element Onboard
  Address=0x48
- FRAM
- REVISION
- DESCRIPTION
- DATE
- APPROVED
- ENG:
- APPROVALS
- PROJECT
- Xuan Hoa Ward, 72117
- Leman Building
- 20 Truong Dinh
- DSN:
- CHK:
- REFERENCE DOCUMENTS
- PROJECT REVISION:
- TITLE
- DOCUMENT REVISION:
- DESIGN ITEM:
- HCMC, Vietnam
- BOM:
- FAB DWG:
- PCB DWG:
- ASSY DWG:
- FILE NAME
- SIZE
- A3
- DWG NO.
- SHEET
- REV
- OF

### Library data of the parts
C2 = CAP_0603: Capacitor SMD 0603; Manufacturer: *; Manufacturer Part Number: *; Distributor Link: *; LCSC: *; Rating: *; Dielectric: *
C47-C49 = CAP_0402: Capacitor SMD 0402; Manufacturer: *; Manufacturer Part Number: *; Distributor Link: *; LCSC: *; Rating: *; Dielectric: *
FB4 = FB_0402: Ferrite Bead SMD 0402; Manufacturer: *; Manufacturer Part Number: *; Distributor Link: *; LCSC: *
J1 = TF-15x15: -25℃~+85℃ 2mm Connector and Ejector MicroSD Card (TF Card) Push-Push SMD SD Card / Memory Card Connector ROHS
Q1 = 0a9ea7c96deaaede766a5b531c28de0: MOSFET N-CH 30V 5.7A SOT23; Input Capacitance: 630pF; Number of Elements: 1; Rds On Max: 26.5mR; Max Power Dissipation: 1.4W; Gate to Source Voltage (Vgs): 12V; Min Operating Temperature: -55°C; Lead Free: Lead Free; Number of Pins: 3; Drain to Source Voltage (Vdss): 30V; Case/Package: SOT-23; Mount: Surface Mount; Continuous Drain Current (ID): 5.7A; Radiation Hardening: No; Packaging: Tape and Reel; Max Operating Temperature: 150°C; Power Dissipation: 1.4W
R31-R36 R43-R45 = RES_0402: Resistor SMD 0402; Manufacturer: *; Manufacturer Part Number: *; Distributor Link: *; LCSC: *
U6 = 477818e52a7d8a150ec960bcaa5cafa: ECC RSA AES DES MIFARE KDF CL-IF
U7 = FM25V02A-G: NVRAM NVRAM FRAM Memory Serial; Manufacturer_Name: Infineon; Geometry.Height: 1.549mm; Manufacturer_Part_Number: FM25V02A-G; Mouser Part Number: 727-FM25V02A-G; Mouser Price/Stock: https://www.mouser.co.uk/ProductDetail/Infineon-Technologies/FM25V02A-G?qs=IxCaM9nJKKU1F7p7SsPN2Q%3D%3D; Arrow Part Number: FM25V02A-G; Arrow Price/Stock: https://www.arrow.com/en/products/fm25v02a-g/infineon-technologies-ag?region=europe; Datasheet Link: https://componentsearchengine.com/Datasheets/1/FM25V02A-G.pdf

## Sheet Sensors.SchDoc
size 420 x 297 mm; SheetNumber: 5; SheetTotal: 5
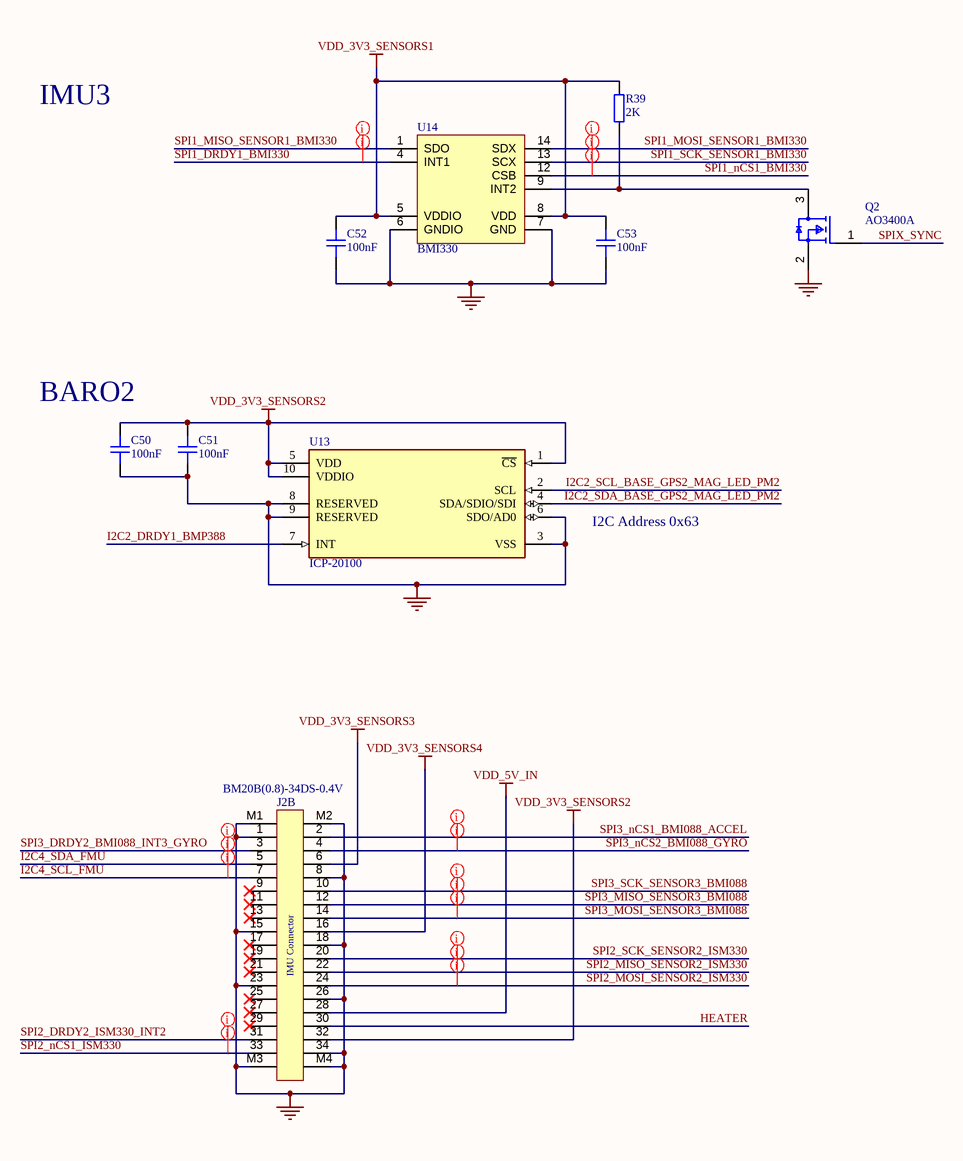
[diagram p4: Sensors.SchDoc]

### Parts
C50  100nF  [CAPC1005X05N]
C51  100nF  [CAPC1005X05N]
C52  100nF  [CAPC1005X05N]
C53  100nF  [CAPC1005X05N]
J2  BM20B(0.8)-34DS-0.4V  [BM20B(0.8)-34DS-0.4V]  (part B of 2)
Q2  AO3400A  [SOT95P280X125-3N]
R39  2K  [RESC1005X04N]
U13  ICP-20100  [BMP390]
U14  BMI330  [ICM-45686]

### Nets
GND: C50.1 C51.1 C52.1 C53.1 J2.1 J2.8 J2.15 J2.18 J2.23 J2.26 J2.34 J2.M1 J2.M2 J2.M3 J2.M4 Q2.2(S) U13.3(VSS) U13.6(SDO/AD0) U13.8(RESERVED) U13.9(RESERVED) U14.6(GNDIO) U14.7(GND)
VDD_3V3_SENSORS1: C52.2 C53.2 R39.2 U14.5(VDDIO) U14.8(VDD)
VDD_3V3_SENSORS2: C50.2 C51.2 J2.32 U13.1(~{CS}) U13.5(VDD) U13.10(VDDIO)
VDD_3V3_SENSORS3: J2.6
VDD_3V3_SENSORS4: J2.16
VDD_5V_IN: J2.28
HEATER: J2.30
I2C2_DRDY1_BMP388: U13.7(INT)
I2C2_SCL_BASE_GPS2_MAG_LED_PM2: U13.2(SCL)
I2C2_SDA_BASE_GPS2_MAG_LED_PM2: U13.4(SDA/SDIO/SDI)
I2C4_SCL_FMU: J2.7
I2C4_SDA_FMU: J2.5
SPI1_DRDY1_BMI330: U14.4(INT1)
SPI1_MISO_SENSOR1_BMI330: U14.1(SDO)
SPI1_MOSI_SENSOR1_BMI330: U14.14(SDX)
SPI1_nCS1_BMI330: U14.12(CSB)
SPI1_SCK_SENSOR1_BMI330: U14.13(SCX)
SPI2_DRDY2_ISM330_INT2: J2.31
SPI2_MISO_SENSOR2_ISM330: J2.22
SPI2_MOSI_SENSOR2_ISM330: J2.24
SPI2_nCS1_ISM330: J2.33
SPI2_SCK_SENSOR2_ISM330: J2.20
SPI3_DRDY2_BMI088_INT3_GYRO: J2.3
SPI3_MISO_SENSOR3_BMI088: J2.12
SPI3_MOSI_SENSOR3_BMI088: J2.14
SPI3_nCS1_BMI088_ACCEL: J2.2
SPI3_nCS2_BMI088_GYRO: J2.4
SPI3_SCK_SENSOR3_BMI088: J2.10
SPIX_SYNC: Q2.1(G)
NetQ2_3: Q2.3(D) R39.1 U14.9(INT2)

Not connected (* = marked no-connect by the designer): J2 9* 11* 13* 17* 19* 21* 25* 27* 29*

### Layout directives
net class SPI1: SPI1_DRDY1_BMI330, SPI1_MISO_SENSOR1_BMI330, SPI1_MOSI_SENSOR1_BMI330, SPI1_nCS1_BMI330, SPI1_SCK_SENSOR1_BMI330
net class SPI3: SPI3_DRDY2_BMI088_INT3_GYRO, SPI3_MISO_SENSOR3_BMI088, SPI3_MOSI_SENSOR3_BMI088, SPI3_nCS1_BMI088_ACCEL, SPI3_nCS2_BMI088_GYRO, SPI3_SCK_SENSOR3_BMI088
net class SPI2: SPI2_DRDY2_ISM330_INT2, SPI2_MISO_SENSOR2_ISM330, SPI2_MOSI_SENSOR2_ISM330, SPI2_nCS1_ISM330, SPI2_SCK_SENSOR2_ISM330
net class I2C4: I2C4_SCL_FMU, I2C4_SDA_FMU

### Notes on the sheet
- IMU3
- (near C50) BARO2
- I2C Address 0x63
- REVISION
- DESCRIPTION
- DATE
- APPROVED
- ENG:
- APPROVALS
- PROJECT
- Xuan Hoa Ward, 72117
- Leman Building
- 20 Truong Dinh
- DSN:
- CHK:
- REFERENCE DOCUMENTS
- PROJECT REVISION:
- TITLE
- DOCUMENT REVISION:
- DESIGN ITEM:
- HCMC, Vietnam
- BOM:
- FAB DWG:
- PCB DWG:
- ASSY DWG:
- FILE NAME
- SIZE
- A3
- DWG NO.
- SHEET
- REV
- OF
- (in symbol IMU PCB connector, part B) IMU Connector

### Library data of the parts
C50-C53 = CAP_0402: Capacitor SMD 0402; Manufacturer: *; Manufacturer Part Number: *; Distributor Link: *; LCSC: *; Rating: *; Dielectric: *
J2 = IMU PCB connector: 34 Position Connector Header, Outer Shroud Contacts Surface Mount Gold
Q2 = 0a9ea7c96deaaede766a5b531c28de0: as Q1 on sheet Memory; Min Operating Temperature: -55°C; Lead Free: Lead Free; Number of Pins: 3; Drain to Source Voltage (Vdss): 30V; Case/Package: SOT-23; Mount: Surface Mount; Continuous Drain Current (ID): 5.7A; Radiation Hardening: No; Packaging: Tape and Reel; Max Operating Temperature: 150°C; Power Dissipation: 1.4W
R39 = RES_0402: Resistor SMD 0402; Manufacturer: *; Manufacturer Part Number: *; Distributor Link: *; LCSC: *
U13 = 2c5c2094cf923c2d68761797ff94764: ICP-20100 Barometric Pressure and Temperature Sensor IC Digital Output 1.8V/3.3V 10-Pin LGA T/R; NexarPartId: 111934633; Width: 2mm; Min Length: 1.92mm; Max Thickness: 800µm; Max Width: 2.08mm; Min Operating Temperature: -40°C; Max Length: 2.08mm; Min Width: 1.92mm; Min Thickness: 640µm; Length: 2mm
U14 = BMI330: Bosch Sensortec Accelerometer, Gyroscope, Temperature, 3 Axis Sensor I²C, I3C℠, SPI Output

## Nets that join several sheets
FMU_VDD_3V3: FMU MCU (41 pins), Power (FB2.2), PAB (J3.84 J3.86), Memory (C49.2 U7.3 U7.7 U7.8)
GND: FMU MCU (63 pins), Power (37 pins), PAB (49 pins), Memory (13 pins), Sensors (22 pins)
VDD_3V3_SD_CARD: Power (FB1.2 R20.2), Memory (7 pins)
VDD_3V3_SENSORS1: Power (C35.2 R4.2 U8.5), Sensors (5 pins)
VDD_3V3_SENSORS2: Power (C11.2 R12.2 U2.5), Sensors (6 pins)
VDD_3V3_SENSORS3: Power (C12.2 R14.2 U3.5), Sensors (J2.6)
VDD_3V3_SENSORS4: Power (C13.2 R16.2 U4.5), Memory (FB4.2), Sensors (J2.16)
VDD_5V_IN: Power (C1.1 C14.1 R18.2), PAB (J3.49 J3.51 J3.53 J3.55), Sensors (J2.28)
ADC1_3V3: FMU MCU (U5.M5), PAB (J3.92)
ADC1_6V6: FMU MCU (U5.M4), PAB (J3.90)
BUZZER_1: FMU MCU (U5.L2), PAB (J3.4)
CAN1_RX: FMU MCU (U5.B12), PAB (J3.65)
CAN1_TX: FMU MCU (U5.C12), PAB (J3.63)
CAN2_RX: FMU MCU (U5.P12), PAB (J3.59)
CAN2_TX: FMU MCU (U5.P13), PAB (J3.57)
ETH_CRS_DV: FMU MCU (U5.R3), PAB (J4.7)
ETH_MDC: FMU MCU (U5.M3), PAB (J4.4)
ETH_MDIO: FMU MCU (U5.P2), PAB (J4.2)
ETH_POWER_EN: FMU MCU (U5.B7), PAB (J4.6)
ETH_REF_CLK: FMU MCU (U5.N2), PAB (J4.3)
ETH_RXD0: FMU MCU (U5.N5), PAB (J4.11)
ETH_RXD1: FMU MCU (U5.P5), PAB (J4.15)
ETH_TX_EN: FMU MCU (U5.R13), PAB (J4.27)
ETH_TXD0: FMU MCU (U5.A8), PAB (J4.19)
ETH_TXD1: FMU MCU (U5.B8), PAB (J4.23)
FMU_CAP1: FMU MCU (U5.P10), PAB (J3.97)
FMU_CH1: FMU MCU (U5.E14), PAB (J3.17)
FMU_CH2: FMU MCU (U5.K12), PAB (J3.15)
FMU_CH3: FMU MCU (U5.L12), PAB (J3.13)
FMU_CH4: FMU MCU (U5.L13), PAB (J3.11)
FMU_CH5: FMU MCU (U5.M15), PAB (J3.7)
FMU_CH6: FMU MCU (U5.M14), PAB (J3.5)
FMU_CH7: FMU MCU (U5.M11), PAB (J3.3)
FMU_CH8: FMU MCU (U5.M13), PAB (J3.1)
FMU_nRST: FMU MCU (U5.J1), PAB (J3.87)
FMU_nSAFETY_SWITCH_LED_OUT: FMU MCU (U5.N15), PAB (J3.23)
FMU_PPM_INPUT: FMU MCU (U5.C4), PAB (J3.39)
FMU_SAFETY_SWITCH_IN: FMU MCU (U5.K3), PAB (J3.21)
FMU_SWCLK: FMU MCU (U5.A14), PAB (J3.77)
FMU_SWDIO: FMU MCU (U5.A15), PAB (J3.75)
HEATER: FMU MCU (U5.R12), Sensors (J2.30)
HW_VER_REV_DRIVE: FMU MCU (R42.2 U5.N7), PAB (J3.25)
HW_VER_SENSE: FMU MCU (U5.G4), PAB (J3.27)
I2C1_SCL_BASE_GPS1_MAG_LED_PM1: FMU MCU (R22.1 U5.A5), PAB (J3.18)
I2C1_SDA_BASE_GPS1_MAG_LED_PM1: FMU MCU (R23.1 U5.B4), PAB (J3.16)
I2C2_DRDY1_BMP388: FMU MCU (U5.K13), Sensors (U13.7)
I2C2_SCL_BASE_GPS2_MAG_LED_PM2: FMU MCU (R26.1 U5.H3), PAB (J3.14), Sensors (U13.2)
I2C2_SDA_BASE_GPS2_MAG_LED_PM2: FMU MCU (R25.1 U5.E2), PAB (J3.12), Sensors (U13.4)
I2C3_SCL_EXTERNAL1: FMU MCU (R27.1 U5.F15), PAB (J3.10)
I2C3_SDA_EXTERNAL1: FMU MCU (R28.1 U5.M12), PAB (J3.8)
I2C4_SCL_FMU: FMU MCU (R29.1 U5.R7), Memory (U6.10), Sensors (J2.7)
I2C4_SDA_FMU: FMU MCU (R30.1 U5.P7), Memory (U6.9), Sensors (J2.5)
nARMED: FMU MCU (U5.B3), PAB (J3.85)
NFC_GPIO: FMU MCU (U5.M2), PAB (J4.48)
nPOWER_IN_A: FMU MCU (U5.M7), PAB (J3.89)
nPOWER_IN_B: FMU MCU (U5.L15), PAB (J3.91)
nPOWER_IN_C: FMU MCU (U5.K15), PAB (J3.93)
PG6: FMU MCU (U5.J15), PAB (J4.44)
SCALED_V5: FMU MCU (U5.R4), Power (R18.1 R19.2)
SCALED_VDD_3V3_SENSORS1: FMU MCU (U5.N3), Power (R4.1 R11.2)
SCALED_VDD_3V3_SENSORS2: FMU MCU (U5.N4), Power (R12.1 R13.2)
SCALED_VDD_3V3_SENSORS3: FMU MCU (U5.R5), Power (R14.1 R15.2)
SCALED_VDD_3V3_SENSORS4: FMU MCU (U5.P6), Power (R16.1 R17.2)
SDMMC2_CLK: FMU MCU (U5.B11), Memory (J1.5)
SDMMC2_CMD: FMU MCU (U5.A11), Memory (J1.3 R34.1)
SDMMC2_D0: FMU MCU (U5.R14), Memory (J1.7 R35.1)
SDMMC2_D1: FMU MCU (U5.R15), Memory (J1.8 R36.1)
SDMMC2_D2: FMU MCU (U5.B9), Memory (J1.1 R32.1)
SDMMC2_D3: FMU MCU (U5.A9), Memory (J1.2 R33.1)
SE050_EN: FMU MCU (U5.L14), Memory (Q1.1)
SPI1_DRDY1_BMI330: FMU MCU (U5.H2), Sensors (U14.4)
SPI1_MISO_SENSOR1_BMI330: FMU MCU (U5.C10), Sensors (U14.1)
SPI1_MOSI_SENSOR1_BMI330: FMU MCU (U5.A6), Sensors (U14.14)
SPI1_nCS1_BMI330: FMU MCU (U5.D3), Sensors (U14.12)
SPI1_SCK_SENSOR1_BMI330: FMU MCU (U5.P4), Sensors (U14.13)
SPI2_DRDY2_ISM330_INT2: FMU MCU (U5.D15), Sensors (J2.31)
SPI2_MISO_SENSOR2_ISM330: FMU MCU (U5.C14), Sensors (J2.22)
SPI2_MOSI_SENSOR2_ISM330: FMU MCU (U5.C13), Sensors (J2.24)
SPI2_nCS1_ISM330: FMU MCU (U5.J4), Sensors (J2.33)
SPI2_SCK_SENSOR2_ISM330: FMU MCU (U5.D14), Sensors (J2.20)
SPI3_DRDY2_BMI088_INT3_GYRO: FMU MCU (U5.C2), Sensors (J2.3)
SPI3_MISO_SENSOR3_BMI088: FMU MCU (U5.B13), Sensors (J2.12)
SPI3_MOSI_SENSOR3_BMI088: FMU MCU (U5.M6), Sensors (J2.14)
SPI3_nCS1_BMI088_ACCEL: FMU MCU (U5.D4), Sensors (J2.2)
SPI3_nCS2_BMI088_GYRO: FMU MCU (U5.D2), Sensors (J2.4)
SPI3_SCK_SENSOR3_BMI088: FMU MCU (U5.B14), Sensors (J2.10)
SPI4_DRDY1: FMU MCU (U5.J2), PAB (J4.18)
SPI4_MISO_SENSOR4: FMU MCU (U5.N11), PAB (J4.12)
SPI4_MOSI_SENSOR4: FMU MCU (U5.P11), PAB (J4.14)
SPI4_nCS1: FMU MCU (U5.D13), PAB (J4.20)
SPI4_SCK_SENSOR4: FMU MCU (U5.R10), PAB (J4.10)
SPI5_MISO_FRAM: FMU MCU (U5.N12), Memory (U7.2)
SPI5_MOSI_FRAM: FMU MCU (U5.R6), Memory (U7.5)
SPI5_nCS1_FRAM: FMU MCU (U5.J14), Memory (U7.1)
SPI5_SCK_FRAM: FMU MCU (U5.K1), Memory (U7.6)
SPI6_DRDY1_EXTERNAL1: FMU MCU (U5.N14), PAB (J4.47)
SPI6_DRDY2_EXTERNAL1: FMU MCU (U5.N13), PAB (J4.45)
SPI6_MISO_EXTERNAL1: FMU MCU (U5.P3), PAB (J4.31)
SPI6_MOSI_EXTERNAL1: FMU MCU (U5.A7), PAB (J4.33)
SPI6_nCS1_EXTERNAL1: FMU MCU (U5.E3), PAB (J4.41)
SPI6_nCS2_EXTERNAL1: FMU MCU (U5.A13), PAB (J4.43)
SPI6_nRESET_EXTERNAL1: FMU MCU (U5.L1), PAB (J4.39)
SPI6_SCK_EXTERNAL1: FMU MCU (U5.A10), PAB (J4.35)
SPIX_SYNC: FMU MCU (U5.P9), PAB (J4.49), Sensors (Q2.1)
UART4_RX: FMU MCU (U5.E13), PAB (J3.96)
UART4_TX: FMU MCU (U5.E12), PAB (J3.98)
UART5_CTS_TELEM2: FMU MCU (U5.F14), PAB (J3.60)
UART5_RTS_TELEM2: FMU MCU (U5.G14), PAB (J3.58)
UART5_RX_TELEM2: FMU MCU (U5.D12), PAB (J3.54)
UART5_TX_TELEM2: FMU MCU (U5.A12), PAB (J3.52)
UART7_CTS_TELEM1: FMU MCU (U5.R9), PAB (J3.24)
UART7_RTS_TELEM1: FMU MCU (U5.L3), PAB (J3.22)
UART7_RX_TELEM1: FMU MCU (U5.K2), PAB (J3.66)
UART7_TX_TELEM1: FMU MCU (U5.P8), PAB (J3.64)
UART8_RX_GPS2: FMU MCU (U5.A4), PAB (J3.30)
UART8_TX_GPS2: FMU MCU (U5.A3), PAB (J3.28)
USART1_RX_GPS1: FMU MCU (U5.B5), PAB (J3.34)
USART1_TX_GPS1: FMU MCU (U5.B6), PAB (J3.36)
USART2_CTS_TELEM3: FMU MCU (U5.D11), PAB (J3.48)
USART2_RTS_TELEM3: FMU MCU (U5.D10), PAB (J3.46)
USART2_RX_TELEM3: FMU MCU (U5.R2), PAB (J3.42)
USART2_TX_TELEM3: FMU MCU (U5.C11), PAB (J3.40)
USART3_RX_DEBUG: FMU MCU (U5.P14), PAB (J3.71)
USART3_TX_DEBUG: FMU MCU (U5.P15), PAB (J3.69)
USART6_RX_FROM_IO__RC_INPUT: FMU MCU (U5.G15), PAB (J3.70)
USART6_TX_TO_IO__NC: FMU MCU (U5.H15), PAB (J3.72)
USB_D_N: FMU MCU (U5.C15), PAB (J3.78)
USB_D_P: FMU MCU (U5.B15), PAB (J3.76)
V_RTC_BAT: FMU MCU (BT1.1 R21.2 U5.C1), PAB (J3.29)
VBUS_SENSE: FMU MCU (U5.E15), PAB (J3.80)
VDD_3V3_SD_CARD_EN: FMU MCU (U5.D1), Power (R9.1 U9.5)
VDD_3V3_SENSORS1_EN: FMU MCU (U5.E4), Power (R7.1 U8.3)
VDD_3V3_SENSORS2_EN: FMU MCU (U5.J3), Power (R1.1 U2.3)
VDD_3V3_SENSORS3_EN: FMU MCU (U5.R8), Power (R2.1 U3.3)
VDD_3V3_SENSORS4_EN: FMU MCU (U5.H14), Power (R3.1 U4.3)
VDD_3V3_SPEKTRUM_POWER_EN: FMU MCU (U5.F4), PAB (J3.33)
VDD_5V_HIPOWER_nEN: FMU MCU (U5.B10), PAB (J3.81)
VDD_5V_HIPOWER_nOC: FMU MCU (U5.N6), PAB (J3.83)
VDD_5V_PERIPH_nEN: FMU MCU (U5.K14), PAB (J3.35)
VDD_5V_PERIPH_nOC: FMU MCU (U5.R11), PAB (J3.37)

## Assembly variants
No_VER_Resistors: not fitted R41 R42